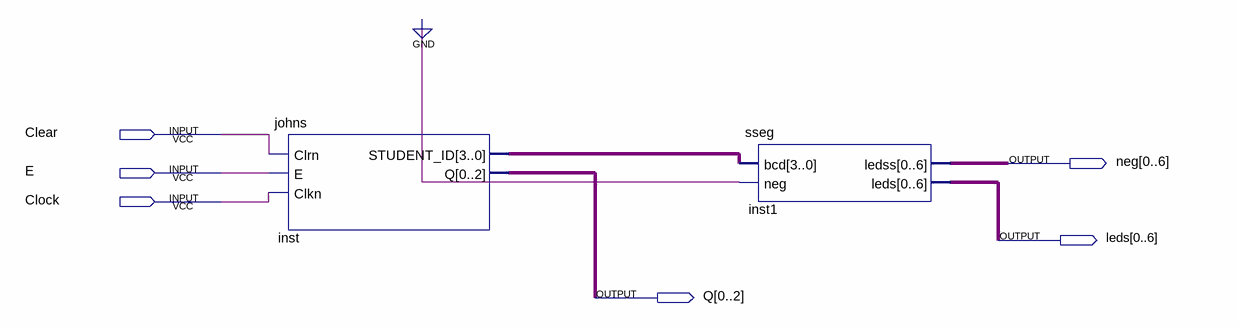
[diagram p0: schematic sheet]
// Quartus schematic Lab5.bdf as structural Verilog: 2 symbols, 6 pins
module Lab5 (
  input  Clear,
  input  E,
  input  Clock,
  output [0:6] neg,
  output [0:6] leds,
  output [0:2] Q
);

  wire [3:0] inst_student_id;

  johns inst (.Clrn(Clear), .E(E), .Clkn(Clock), .STUDENT_ID(inst_student_id), .Q(Q));
  sseg inst1 (.bcd(inst_student_id), .neg(1'b0), .ledss(neg), .leds(leds));
endmodule
